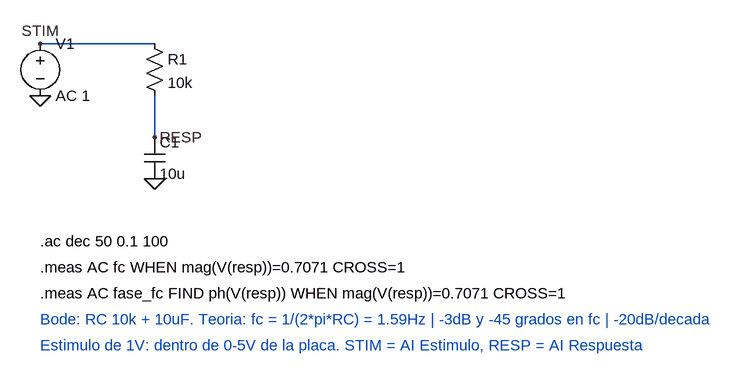
[diagram p0: schematic analizador_bode.asc]
analizador_bode.asc, the LTspice schematic file:
Version 4
SHEET 1 880 680
WIRE 0 16 176 16
WIRE 176 96 176 160
FLAG 0 96 0
FLAG 0 16 STIM
FLAG 176 160 RESP
FLAG 176 224 0
SYMBOL voltage 0 0 R0
SYMATTR InstName V1
SYMATTR Value AC 1
SYMBOL res 160 0 R0
SYMATTR InstName R1
SYMATTR Value 10k
SYMBOL cap 160 160 R0
SYMATTR InstName C1
SYMATTR Value 10u
TEXT 0 320 Left 2 !.ac dec 50 0.1 100
TEXT 0 360 Left 2 !.meas AC fc WHEN mag(V(resp))=0.7071 CROSS=1
TEXT 0 400 Left 2 !.meas AC fase_fc FIND ph(V(resp)) WHEN mag(V(resp))=0.7071 CROSS=1
TEXT 0 440 Left 2 ;Bode: RC 10k + 10uF. Teoria: fc = 1/(2*pi*RC) = 1.59Hz | -3dB y -45 grados en fc | -20dB/decada
TEXT 0 480 Left 2 ;Estimulo de 1V: dentro de 0-5V de la placa. STIM = AI Estimulo, RESP = AI Respuesta

The netlist it stands for:
* analizador_bode.asc
V1 STIM 0 AC 1
R1 STIM RESP 10k
C1 RESP 0 10u
.ac dec 50 0.1 100
.meas AC fc WHEN mag(V(resp))=0.7071 CROSS=1
.meas AC fase_fc FIND ph(V(resp)) WHEN mag(V(resp))=0.7071 CROSS=1
* Bode: RC 10k + 10uF. Teoria: fc = 1/(2*pi*RC) = 1.59Hz | -3dB y -45 grados en fc | -20dB/decada
* Estimulo de 1V: dentro de 0-5V de la placa. STIM = AI Estimulo, RESP = AI Respuesta
.backanno
.end